# Altium schematic sheet TEMP_MEASURE.SchDoc
size A4; SheetNumber: 7; SheetTotal: 9
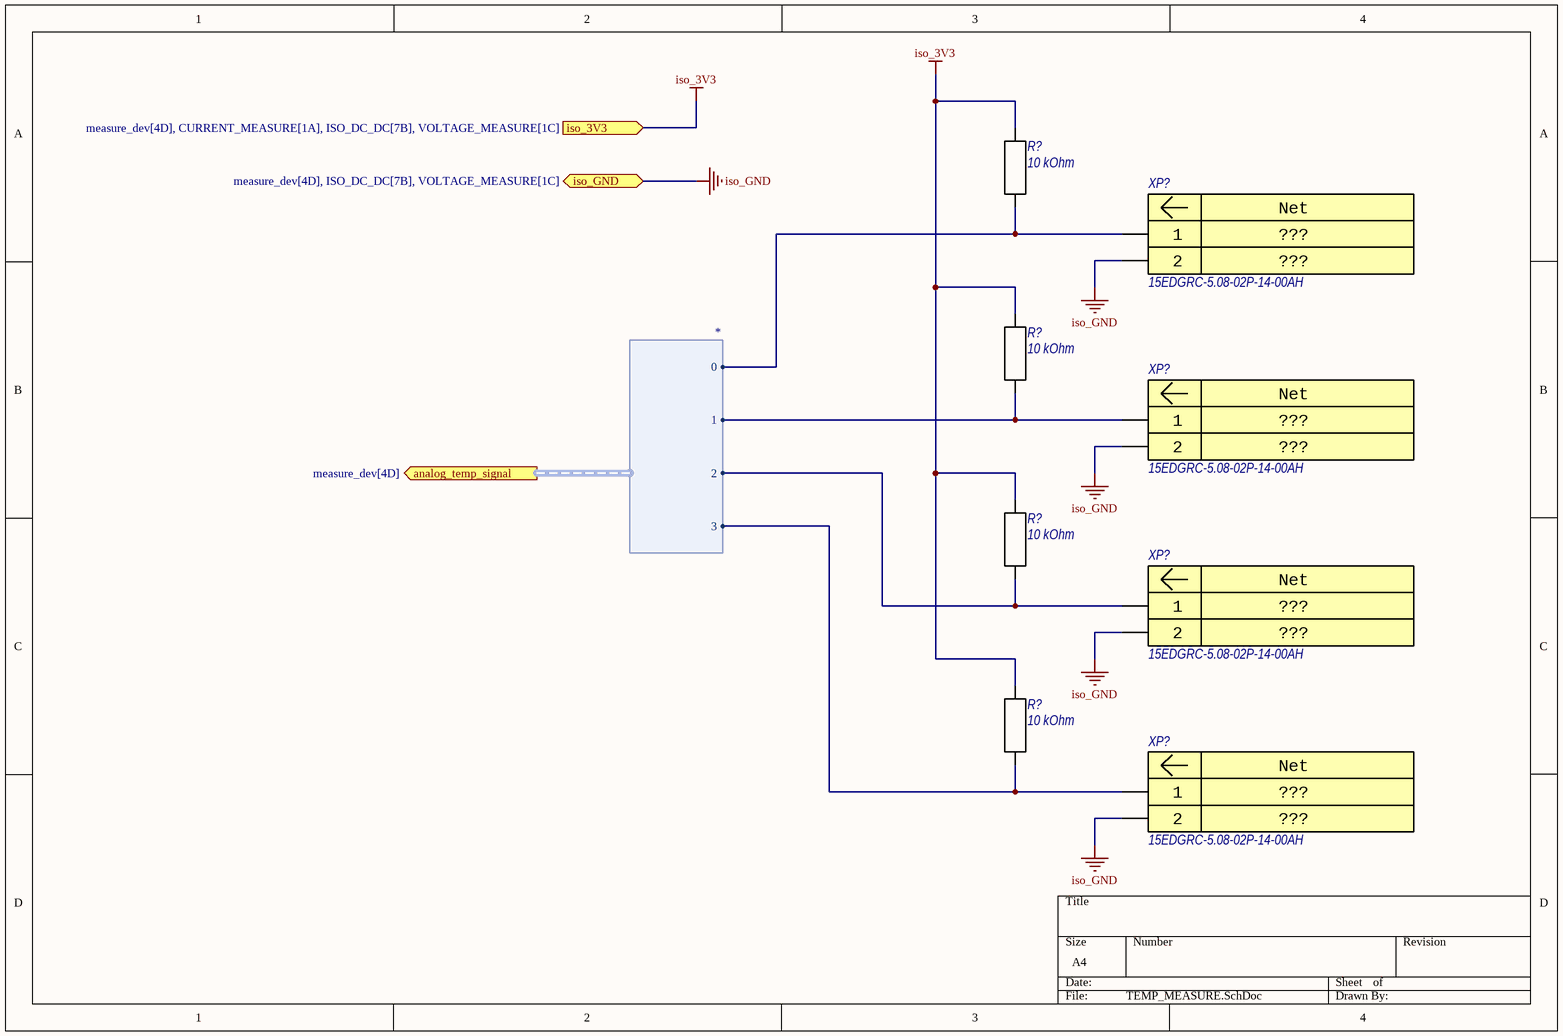
[diagram p0: TEMP_MEASURE.SchDoc]

## Parts
(Parts that share a designator on the sheet are numbered #1, #2 ... from top to bottom, then left to right.)
R?#1  10 kOhm  [0603R]
R?#2  10 kOhm  [0603R]
R?#3  10 kOhm  [0603R]
R?#4  10 kOhm  [0603R]
XP?#1  15EDGRC-5.08-02P-14-00AH  [15EDGRC-5.08-02P]
XP?#2  15EDGRC-5.08-02P-14-00AH  [15EDGRC-5.08-02P]
XP?#3  15EDGRC-5.08-02P-14-00AH  [15EDGRC-5.08-02P]
XP?#4  15EDGRC-5.08-02P-14-00AH  [15EDGRC-5.08-02P]

## Ports
analog_temp_signal (out, harness *, see measure_dev[4D]), iso_3V3 (in, see measure_dev[4D], CURRENT_MEASURE[1A], ISO_DC_DC[7B], VOLTAGE_MEASURE[1C]), iso_GND (bidir, see measure_dev[4D], ISO_DC_DC[7B], VOLTAGE_MEASURE[1C])

## Harnesses
*: 0, 1, 2, 3

## Nets
iso_3V3: R?#1.2 R?#2.2 R?#3.2 R?#4.2 ; port iso_3V3
iso_GND: XP?#1.2 XP?#2.2 XP?#3.2 XP?#4.2 ; port iso_GND
NetR?#1_1: R?#1.1 XP?#1.1 ; port analog_temp_signal.0
NetR?#2_1: R?#2.1 XP?#2.1 ; port analog_temp_signal.1
NetR?#3_1: R?#3.1 XP?#3.1 ; port analog_temp_signal.2
NetR?#4_1: R?#4.1 XP?#4.1 ; port analog_temp_signal.3

## Notes on the sheet
- (in symbol 15EDGRC-5.08-02P-14-00AH) Net

## Library data of the parts
R?#1-R?#4 = RC0603FR-0710KL: Manufacturer: Yageo; Tolerance: 1%; Power: 0.100 Watt; Part Number: RC0603FR-0710KL; Package: 0603; Value: 10 kOhm
XP?#1-XP?#4 = 15EDGRC-5.08-02P-14-00AH: Manufacturer: DEGSON; Imax: 7 A; Umax: 450 V; Mating Connector: 15EDGK-5.08-02P-14; pin1: ???; Part Number: 15EDGRC-5.08-02P-14-00AH; Datasheet: https://cdn.promelec.ru/upload/items/2020/05/15/15EDGRC-5.08.pdf; pin2: ???; pin3: ???; pin4: ???; pin5: ???; pin6: ???; pin7: ???; pin8: ???; pin9: ???; pin10: ???; pin11: ???; pin12: ???; pin13: ???; pin14: ???; pin15: ???; pin16: ???; pin17: ???; pin18: ???; pin19: ???; pin20: ???; pin21: ???; pin22: ???; pin23: ???; pin24: ???; pin25: ???; pin26: ???; pin27: ???; pin28: ???; pin29: ???; pin30: ???; pin31: ???; pin32: ???; pin33: ???; pin34: ???; pin35: ???; pin36: ???; pin37: ???; pin38: ???; pin39: ???; pin40: ???; pin41: ???; pin42: ???; pin43: ???; pin44: ???; pin45: ???; pin46: ???; pin47: ???; pin48: ???; pin49: ???; pin50: ???